# Altium schematic sheet SD_CARD.SchDoc
size A4; SheetNumber: 7; SheetTotal: 9
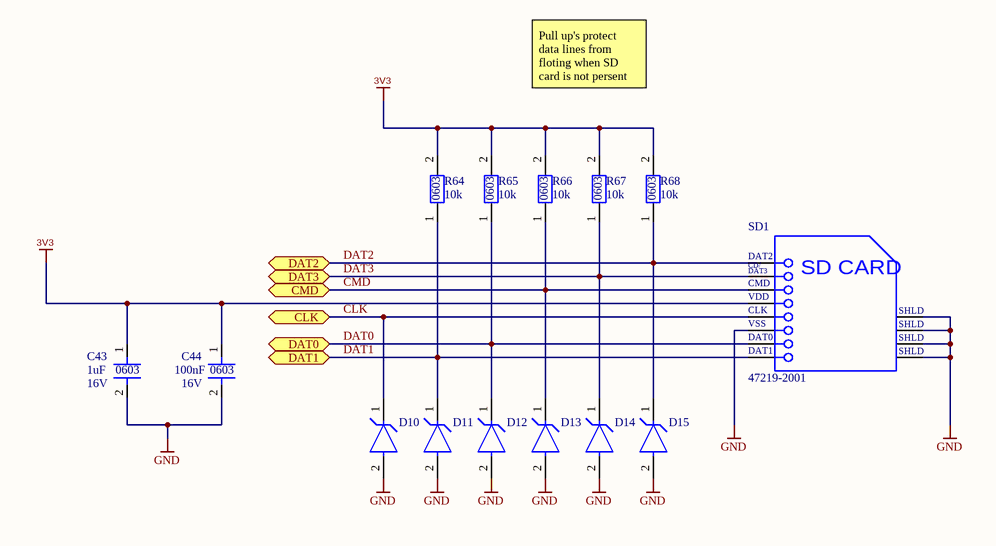
[diagram p0: SD_CARD.SchDoc]

## Parts
C43  SMD 0603 Capacitor  [CAPACITOR_SMD_0603]  (value not drawn)
C44  SMD 0603 Capacitor  [CAPACITOR_SMD_0603]  (value not drawn)
D10  ESD7351HT1G  [FP-477-02-MFG]  (value not drawn)
D11  ESD7351HT1G  [FP-477-02-MFG]  (value not drawn)
D12  ESD7351HT1G  [FP-477-02-MFG]  (value not drawn)
D13  ESD7351HT1G  [FP-477-02-MFG]  (value not drawn)
D14  ESD7351HT1G  [FP-477-02-MFG]  (value not drawn)
D15  ESD7351HT1G  [FP-477-02-MFG]  (value not drawn)
R64  SMD 0603 Resistor  [RESISTOR_SMD_0603]  (value not drawn)
R65  SMD 0603 Resistor  [RESISTOR_SMD_0603]  (value not drawn)
R66  SMD 0603 Resistor  [RESISTOR_SMD_0603]  (value not drawn)
R67  SMD 0603 Resistor  [RESISTOR_SMD_0603]  (value not drawn)
R68  SMD 0603 Resistor  [RESISTOR_SMD_0603]  (value not drawn)
SD1  47219-2001  [MOLX-47219-2001-8_V]

## Ports
CLK (bidir, see MAIN_SCHEMATIC[3C], STM32[2C]), CMD (bidir, see MAIN_SCHEMATIC[3C], STM32[3B]), DAT0 (bidir, see MAIN_SCHEMATIC[3C], STM32[2C]), DAT1 (bidir, see MAIN_SCHEMATIC[3C], STM32[2C]), DAT2 (bidir, see MAIN_SCHEMATIC[3C], STM32[2C]), DAT3 (bidir, see MAIN_SCHEMATIC[3C], STM32[2C])

## Nets
3V3: C43.1 C44.1 R64.2 R65.2 R66.2 R67.2 R68.2 SD1.4(VDD)
GND: C43.2 C44.2 D10.2(A) D11.2(A) D12.2(A) D13.2(A) D14.2(A) D15.2(A) SD1.6(VSS) SD1.9(SHLD) SD1.10(SHLD) SD1.11(SHLD) SD1.12(SHLD)
CLK: D10.1(C) SD1.5(CLK) ; port CLK
CMD: D13.1(C) R66.1 SD1.3(CMD) ; port CMD
DAT0: D12.1(C) R65.1 SD1.7(DAT0) ; port DAT0
DAT1: D11.1(C) R64.1 SD1.8(DAT1) ; port DAT1
DAT2: D15.1(C) R68.1 SD1.1(DAT2) ; port DAT2
DAT3: D14.1(C) R67.1 SD1.2(CD/DAT3) ; port DAT3

## Notes on the sheet
- Pull up's protect data lines from floting when SD card is not persent
- (near R64) 10k
- (near R65) 10k
- (near R66) 10k
- (near R67) 10k
- (near R68) 10k
- (near C43) 16V
- (near C43) 1uF
- (near C44) 100nF
- (near C44) 16V
- (in symbol CMP-2000-05245-1) CD/; DAT3; SD CARD
- (in symbol SMD 0603 Capacitor) 0603
- (in symbol SMD 0603 Resistor) 0603

## Library data of the parts
C43 C44 = SMD 0603 Capacitor: 0603 capacitor
D10-D15 = CMP-00278-47358424-1: ESD7351HT1G ESD7351 Series 5 V 0.6 pF Uni-Directional ESD Protection Diode - SOD-323; Manufacturer Lifecycle Status: ACTIVE; Clamping Voltage: 10V; Max Junction Temperature (Tj): 150°C; Reverse Standoff Voltage: 3.3V; Direction: Unidirectional; Breakdown Voltage: 5V; Peak Pulse Power: 150mW; Peak Pulse Current: 3A; Power Line Protection: No; Capacitance: 430fF; Number of Unidirectional Channels: 1; Schedule B: 8536300000; Height: 1mm; Case/Package: SOD; Lifecycle Status: Production; Packaging: Tape & Reel (TR); RoHS: Compliant; Min Operating Temperature: -55°C; Composition: Zener; Max Operating Temperature: 150°C; Mount: Surface Mount; Min Breakdown Voltage: 5V; Lead Free: Lead Free; NexarPartId: 47358424; Number of Channels: 1
R64-R68 = SMD 0603 Resistor: 0603 resistor
SD1 = CMP-2000-05245-1: MicroSD Card Connector, Hinge Type, -40 to 85 degC, 8-Pin SMD, RoHS, Tape and Reel; Manufacturer: Molex; Current Rating: 500mA; Number of Contacts: 8; Pitch: 1.09mm; Insertion - Extraction Style: Hinged; Voltage Rating: 100VDC; Product: CardConnectors; Contact Material: CopperAlloy; Series: 47219; Packaging: Reel; Brand: Molex; Product Category: MemoryCardConnectors; Housing Material: Thermoplastic; Mounting Style: SMD/SMT; Termination Style: SMD; Datasheet Version: Rev. F, 06/2009; Card Type: microSD; Manufacturer URL: http://www.molex.com/; RoHS: Details; Datasheet URL: http://www.molex.com/pdm_docs/sd/472192001_sd.pdf; Factory Pack Quantity: 2400